# Altium project DT10965_MOTOR_CONTROLLER.PrjPcb (part 3 of 4)

## Sheet Resolver.SchDoc: =DT_SCH_Title
size A4; Organization: Droid Technologies; DocumentNumber: DT10965; Revision: 1.0; SheetNumber: 11; SheetTotal: 15
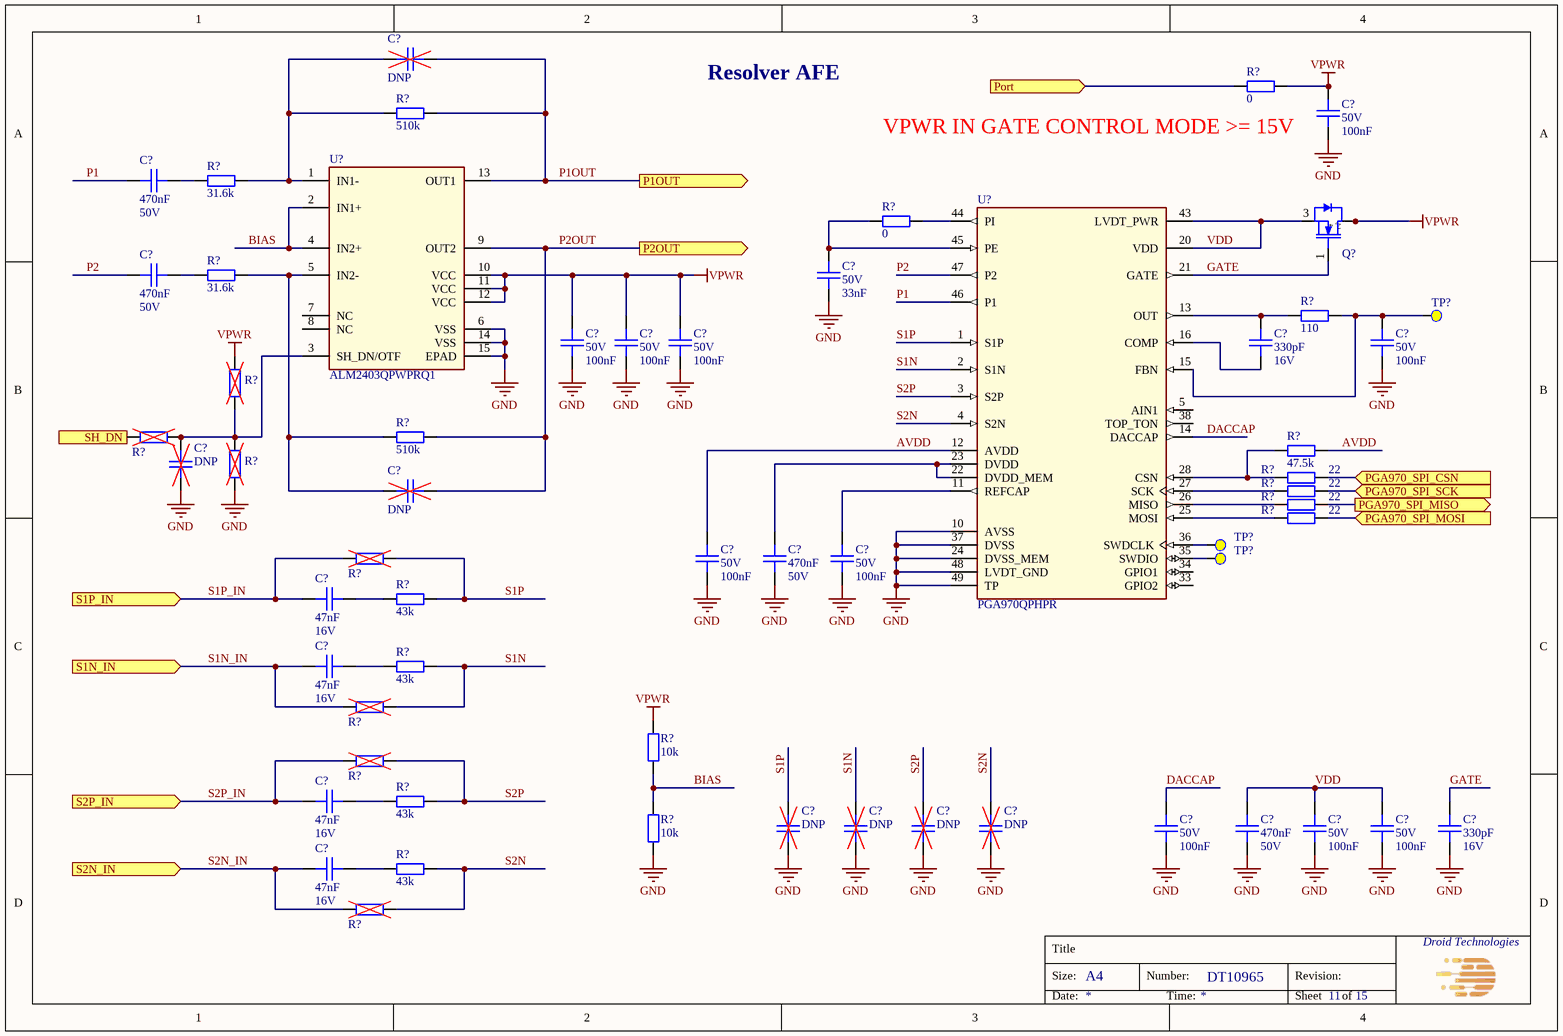
[diagram p8: Resolver.SchDoc]

### Parts
(Parts that share a designator on the sheet are numbered #1, #2 ... from top to bottom, then left to right.)
C?#111  Capacitance: DNP  [CAPC100x50x50L25]  (hidden comment: DNP chip cap 0402)
C?#112  Voltage Rating: 50V  Capacitance: 100nF  [CAPC100x50x50L25]  (hidden comment: GCM155L8EH104KE07D)
C?#113  Capacitance: 470nF  Voltage Rating: 50V  [CAPC200X125X145L50]  (hidden comment: CGA4J1X8L1H474K125AC)
C?#114  Capacitance: 470nF  Voltage Rating: 50V  [CAPC200X125X145L50]  (hidden comment: CGA4J1X8L1H474K125AC)
C?#115  Voltage Rating: 50V  Capacitance: 33nF  [CAPC100x50x50L25]  (hidden comment: GCM155L8EH333KE07D)
C?#116  Voltage Rating: 50V  Capacitance: 100nF  [CAPC100x50x50L25]  (hidden comment: GCM155L8EH104KE07D)
C?#117  Voltage Rating: 50V  Capacitance: 100nF  [CAPC100x50x50L25]  (hidden comment: GCM155L8EH104KE07D)
C?#118  Voltage Rating: 50V  Capacitance: 100nF  [CAPC100x50x50L25]  (hidden comment: GCM155L8EH104KE07D)
C?#119  Capacitance: 330pF  Voltage Rating: 16V  [CAPC160X80X90L35]  (hidden comment: C0603C331J4HACTU)
C?#120  Voltage Rating: 50V  Capacitance: 100nF  [CAPC100x50x50L25]  (hidden comment: GCM155L8EH104KE07D)
C?#121  Capacitance: DNP  [CAPC100x50x50L25]  (hidden comment: DNP chip cap 0402)
C?#122  Capacitance: DNP  [CAPC100x50x50L25]  (hidden comment: DNP chip cap 0402)
C?#123  Capacitance: 470nF  Voltage Rating: 50V  [CAPC200X125X145L50]  (hidden comment: CGA4J1X8L1H474K125AC)
C?#124  Voltage Rating: 50V  Capacitance: 100nF  [CAPC100x50x50L25]  (hidden comment: GCM155L8EH104KE07D)
C?#125  Voltage Rating: 50V  Capacitance: 100nF  [CAPC100x50x50L25]  (hidden comment: GCM155L8EH104KE07D)
C?#126  Capacitance: 47nF  Voltage Rating: 16V  [CAPC100x50x50L25]  (hidden comment: CGA2B3X8R1C473K050BB)
C?#127  Capacitance: 47nF  Voltage Rating: 16V  [CAPC100x50x50L25]  (hidden comment: CGA2B3X8R1C473K050BB)
C?#128  Capacitance: 47nF  Voltage Rating: 16V  [CAPC100x50x50L25]  (hidden comment: CGA2B3X8R1C473K050BB)
C?#129  Capacitance: 470nF  Voltage Rating: 50V  [CAPC200X125X145L50]  (hidden comment: CGA4J1X8L1H474K125AC)
C?#130  Capacitance: DNP  [CAPC100x50x50L25]  (hidden comment: DNP chip cap 0402)
C?#131  Capacitance: DNP  [CAPC100x50x50L25]  (hidden comment: DNP chip cap 0402)
C?#132  Capacitance: DNP  [CAPC100x50x50L25]  (hidden comment: DNP chip cap 0402)
C?#133  Capacitance: DNP  [CAPC100x50x50L25]  (hidden comment: DNP chip cap 0402)
C?#134  Voltage Rating: 50V  Capacitance: 100nF  [CAPC100x50x50L25]  (hidden comment: GCM155L8EH104KE07D)
C?#135  Voltage Rating: 50V  Capacitance: 100nF  [CAPC100x50x50L25]  (hidden comment: GCM155L8EH104KE07D)
C?#136  Voltage Rating: 50V  Capacitance: 100nF  [CAPC100x50x50L25]  (hidden comment: GCM155L8EH104KE07D)
C?#137  Capacitance: 330pF  Voltage Rating: 16V  [CAPC160X80X90L35]  (hidden comment: C0603C331J4HACTU)
C?#138  Capacitance: 47nF  Voltage Rating: 16V  [CAPC100x50x50L25]  (hidden comment: CGA2B3X8R1C473K050BB)
Q?#7  BSP129H6327XTSA1  [SOT-223]  (value not drawn)
R?#146  Resistance: 0  [RESC160X80X55L30]  (hidden comment: RC0603FR-070RL)
R?#147  Resistance: 510k  [RESC100X50X40L25]  (hidden comment: RC0402FR-07510KL)
R?#148  Resistance: 31.6k  [RESC100X50X40L25]  (hidden comment: RC0402FR-0731K6L)
R?#149  Resistance: 0  [RESC160X80X55L30]  (hidden comment: RC0603FR-070RL)
R?#150  Resistance: 31.6k  [RESC100X50X40L25]  (hidden comment: RC0402FR-0731K6L)
R?#151  Resistance: 110  [RESC100X50X40L25]  (hidden comment: RC0402FR-07110RL)
R?#152  DNP chip res 0603  [RESC160X80X55L30]  (value not drawn)
R?#153  DNP chip res 0603  [RESC160X80X55L30]  (value not drawn)
R?#154  Resistance: 510k  [RESC100X50X40L25]  (hidden comment: RC0402FR-07510KL)
R?#155  Resistance: 47.5k  [RESC100X50X40L25]  (hidden comment: RC0402FR-0747K5L)
R?#156  Resistance: 22  [RESC100X50X40L25]  (hidden comment: RC0402FR-0722RL)
R?#157  DNP chip res 0603  [RESC160X80X55L30]  (value not drawn)
R?#158  Resistance: 22  [RESC100X50X40L25]  (hidden comment: RC0402FR-0722RL)
R?#159  Resistance: 22  [RESC100X50X40L25]  (hidden comment: RC0402FR-0722RL)
R?#160  Resistance: 22  [RESC100X50X40L25]  (hidden comment: RC0402FR-0722RL)
R?#161  DNP chip res 0603  [RESC160X80X55L30]  (value not drawn)
R?#162  Resistance: 43k  [RESC100X50X40L25]  (hidden comment: RC0402FR-0743KL)
R?#163  Resistance: 43k  [RESC100X50X40L25]  (hidden comment: RC0402FR-0743KL)
R?#164  DNP chip res 0603  [RESC160X80X55L30]  (value not drawn)
R?#165  DNP chip res 0603  [RESC160X80X55L30]  (value not drawn)
R?#166  Resistance: 10k  [RESC100X50X40L25]  (hidden comment: RC0402FR-0710KL)
R?#167  Resistance: 43k  [RESC100X50X40L25]  (hidden comment: RC0402FR-0743KL)
R?#168  Resistance: 10k  [RESC100X50X40L25]  (hidden comment: RC0402FR-0710KL)
R?#169  Resistance: 43k  [RESC100X50X40L25]  (hidden comment: RC0402FR-0743KL)
R?#170  DNP chip res 0603  [RESC160X80X55L30]  (value not drawn)
TP?#1  TPAD  [PAD_1.0R]  (value not drawn)  (no BOM)
TP?#2  TPAD  [PAD_1.0R]  (value not drawn)  (no BOM)
TP?#3  TPAD  [PAD_1.0R]  (value not drawn)  (no BOM)
U?#32  ALM2403QPWPRQ1  [14-HTSSOP]
U?#33  PGA970QPHPR  [48-HTQFP (7x7)]

### Ports
P1OUT (out), P2OUT (out), PGA970_SPI_CSN (in), PGA970_SPI_MISO (out), PGA970_SPI_MOSI (in), PGA970_SPI_SCK (in), Port (in), S1N_IN (in), S1P_IN (in), S2N_IN (in), S2P_IN (in), SH_DN (out)

### Nets
GND: C?#112.1 C?#115.1 C?#116.1 C?#117.1 C?#118.1 C?#120.1 C?#121.2 C?#123.2 C?#124.1 C?#125.1 C?#129.2 C?#130.1 C?#131.1 C?#132.1 C?#133.1 C?#134.1 C?#135.1 C?#136.1 C?#137.1 R?#157.1 R?#168.1 U?#32.6(VSS) U?#32.14(VSS) U?#32.15(EPAD) U?#33.10(AVSS) U?#33.24(DVSS_MEM) U?#33.37(DVSS) U?#33.48(LVDT_GND) U?#33.49(TP)
VPWR: C?#112.2 C?#116.2 C?#117.2 C?#118.2 Q?#7.2(DRAIN) Q?#7.4(DRAIN) R?#146.2 R?#152.2 R?#166.2 U?#32.10(VCC) U?#32.11(VCC) U?#32.12(VCC)
AVDD: C?#124.2 R?#155.1 U?#33.12(AVDD)
BIAS: R?#166.1 R?#168.2 U?#32.2(IN1+) U?#32.4(IN2+)
DACCAP: C?#134.2 U?#33.14(DACCAP)
GATE: C?#137.2 Q?#7.1(GATE) U?#33.21(GATE)
P1: C?#113.2 U?#33.46(P1)
P1OUT: C?#111.1 R?#147.2 U?#32.13(OUT1) ; port P1OUT
P2: C?#114.2 U?#33.47(P2)
P2OUT: C?#122.1 R?#154.2 U?#32.9(OUT2) ; port P2OUT
S1N: C?#131.2 R?#163.2 R?#164.1 U?#33.2(S1N)
S1N_IN: C?#127.2 R?#164.2 ; port S1N_IN
S1P: C?#130.2 R?#161.1 R?#162.2 U?#33.1(S1P)
S1P_IN: C?#126.2 R?#161.2 ; port S1P_IN
S2N: C?#133.2 R?#169.2 R?#170.1 U?#33.4(S2N)
S2N_IN: C?#138.2 R?#170.2 ; port S2N_IN
S2P: C?#132.2 R?#165.1 R?#167.2 U?#33.3(S2P)
S2P_IN: C?#128.2 R?#165.2 ; port S2P_IN
VDD: C?#129.1 C?#135.2 C?#136.2 Q?#7.3(SOURCE) U?#33.20(VDD) U?#33.43(LVDT_PWR)
NetC?#111_2: C?#111.2 R?#147.1 R?#148.2 U?#32.1(IN1-)
NetC?#113_1: C?#113.1 R?#148.1
NetC?#114_1: C?#114.1 R?#150.1
NetC?#115_2: C?#115.2 R?#149.1 U?#33.45(PE)
NetC?#119_1: C?#119.1 U?#33.16(COMP)
NetC?#119_2: C?#119.2 R?#151.1 U?#33.13(OUT)
NetC?#120_2: C?#120.2 R?#151.2 TP?#1.1(TPoint) U?#33.15(FBN)
NetC?#121_1: C?#121.1 R?#152.1 R?#153.1 R?#157.2 U?#32.3(SH_DN/OTF)
NetC?#122_2: C?#122.2 R?#150.2 R?#154.1 U?#32.5(IN2-)
NetC?#123_1: C?#123.1 U?#33.22(DVDD_MEM) U?#33.23(DVDD)
NetC?#125_2: C?#125.2 U?#33.11(REFCAP)
NetC?#126_1: C?#126.1 R?#162.1
NetC?#127_1: C?#127.1 R?#163.1
NetC?#128_1: C?#128.1 R?#167.1
NetC?#138_1: C?#138.1 R?#169.1
NetR?#146_1: R?#146.1 ; port Port
NetR?#149_2: R?#149.2 U?#33.44(PI)
NetR?#153_2: R?#153.2 ; port SH_DN
NetR?#155_2: R?#155.2 R?#156.1 U?#33.28(CSN)
NetR?#156_2: R?#156.2 ; port PGA970_SPI_CSN
NetR?#158_1: R?#158.1 U?#33.27(SCK)
NetR?#158_2: R?#158.2 ; port PGA970_SPI_SCK
NetR?#159_1: R?#159.1 U?#33.26(MISO)
NetR?#159_2: R?#159.2 ; port PGA970_SPI_MISO
NetR?#160_1: R?#160.1 U?#33.25(MOSI)
NetR?#160_2: R?#160.2 ; port PGA970_SPI_MOSI
NetTP?#2_1: TP?#2.1(TPoint) U?#33.36(SWDCLK)
NetTP?#3_1: TP?#3.1(TPoint) U?#33.35(SWDIO)

Not connected (* = marked no-connect by the designer): U?#32 7(NC) 8(NC); U?#33 5(AIN1) 33(GPIO2) 34(GPIO1) 38(TOP_TON)

### Notes on the sheet
- Resolver AFE
- (near R?#146) VPWR IN GATE CONTROL MODE >= 15V
- Title
- Size:
- A4
- Number:
- Revision:
- Date:
- Time:
- Sheet
- of
- (in symbol BSP129H6327XTSA1) 2, 4

### Library data of the parts
C?#111 C?#121 C?#122 C?#130-C?#133 = CMP-00427-4: DNP cap 0402; Mounting Type: SM; Package: 0402 (1005 Metric); MPN: DNP
C?#112 C?#116-C?#118 C?#120 C?#124 C?#125 C?#134-C?#136 = CMP-001-1980-1: as C?#91-C?#94 on sheet Phase Current_Voltage Sense; Height max: 550µm; ComponentLink3Description: Digikey; Mounting Type: SM; ComponentLink3URL: https://www.digikey.com/en/products/detail/murata-electronics/GCM155L8EH104KE07D/11618823; Package: 0402 (1005 Metric); Lead Spacing: 0mm; MPN: GCM155L8EH104KE07D; Size: 1.00mm x 0.50mm; Ratings: AEC-Q200; ComponentLink1URL: https://search.murata.co.jp/Ceramy/image/img/A01X/G101/ENG/GCM155L8EH104KE07-01.pdf; ComponentLink1Description: Datasheet; Dielectric: X8L; ComponentLink2Description: Mouser; ComponentLink2URL: https://eu.mouser.com/ProductDetail/Murata-Electronics/GCM155L8EH104KE07D?qs=1mbolxNpo8fQSHf0HYnZWw%3D%3D
C?#113 C?#114 C?#123 C?#129 = CMP-001-2015-1: CAP CER 0.47UF 50V X8L 0805; Manufacturer: TDK Corporation; Op Temp min: -55°C; Tolerance: 10%; Op Temp max: 150°C; ComponentLink1Description: Datasheet; Size: 2.00mm x 1.25mm; Dielectric: X8L; ComponentLink3URL: https://www.digikey.com/en/products/detail/tdk-corporation/CGA4J1X8L1H474K125AC/12807037?s=N4IgjCBcoKxaBjKAzAhgGwM4FMA0IB7KAbRAGYYAWAdgA5KQBdfABwBcoQBlNgJwEsAdgHMQAX3xgG0EEkhoseQiRAAmMrWoamrDpG58hoieABs8WSgw58RSKTIBOMqsc6Q7TjwEjx%2BU24ycgo2yvYglAAMjpRg5sweegY%2BxviqMKoWwdZKdqSqlK5kEGmFztQgpa6xlWpllLTunvreRn7gjrSBiFaKtiqRTCaqkZTdlvI5-eGRAHQ0AAQArQBitTSRC4JrCc0gAKqC-GwA8sgAstiomACuvNjtALSZQVB8N7kqcPhujCaP4zk70%2B4QgfzEYiAA; Ratings: AEC-Q200; ComponentLink3Description: Digikey; ComponentLink2Description: Mouser; Mounting Type: SM; Lead Spacing: 0mm; ComponentLink1URL: https://product.tdk.com/system/files/dam/doc/product/capacitor/ceramic/mlcc/catalog/mlcc_automotive_hightemp_en.pdf; MPN: CGA4J1X8L1H474K125AC; Height max: 1.45mm; ComponentLink2URL: https://eu.mouser.com/ProductDetail/TDK/CGA4J1X8L1H474K125AC?qs=W%2FMpXkg%252BdQ5d8zdfD6mokw%3D%3D; Package: 0805 (2012 Metric)
C?#115 = CMP-001-2007-1: CAP CER 0.033UF 50V X8L 0402; Manufacturer: Murata Electronics; Op Temp max: 150°C; Tolerance: 10%; Op Temp min: -55°C; ComponentLink1URL: https://search.murata.co.jp/Ceramy/image/img/A01X/G101/ENG/GCM155L8EH333KE07-01A.pdf; Mounting Type: SM; Dielectric: X8L; ComponentLink3URL: https://www.digikey.com/en/products/detail/murata-electronics/GCM155L8EH333KE07D/17845188; Size: 1.00mm x 0.50mm; ComponentLink1Description: Datasheet; ComponentLink3Description: Digikey; Package: 0402 (1005 Metric); MPN: GCM155L8EH333KE07D; ComponentLink2Description: Mouser; Height max: 550µm; Lead Spacing: 0mm; ComponentLink2URL: https://eu.mouser.com/ProductDetail/Murata-Electronics/GCM155L8EH333KE07D?qs=rrS6PyfT74cZK6FfR7MiFw%3D%3D; Ratings: AEC-Q200
C?#119 C?#137 = CMP-001-2014-1: CAP CER 330PF 16V X8R 0603; Manufacturer: KEMET; Op Temp max: 150°C; Tolerance: 5%; Op Temp min: -55°C; ComponentLink2URL: https://eu.mouser.com/ProductDetail/KEMET/C0603C331J4HACTU?qs=W0yvOO0ixfGIN%252BOCnjHNiQ%3D%3D; MPN: C0603C331J4HACTU; Ratings: -; Height max: 870µm; ComponentLink1Description: Datasheet; ComponentLink3URL: https://www.digikey.com/en/products/detail/kemet/C0603C331J4HACTU/7946553?s=N4IgjCBcpgLFoDGUBmBDANgZwKYBoQB7KAbXAAYAOAdlgCYQBdAgBwBcoQBlNgJwEsAdgHMQAXwJ0ArA2ghkkdNnxFSIOvQCcAZgjMQ7TjwEjxBMJsqaE81JlwFikMuSYT15WNbkKlD1c4g2trkAAQsAGJMrByQIACqgvxsAPIoALI4aFgArrw4ZiAAtLJIUHw5Kk5kUiAE1ozuRd5lkBVVanpi3UA; Size: 1.60mm x 0.80mm; ComponentLink2Description: Mouser; Package: 0603 (1608 Metric); ComponentLink3Description: Digikey; Lead Spacing: 0mm; Mounting Type: SM; Dielectric: X8R; ComponentLink1URL: https://search.kemet.com/download/datasheet/C0603C331J4HAC7867
C?#126-C?#128 C?#138 = CMP-001-2016-1: CAP CER 0.047UF 16V X8R 0402; Manufacturer: TDK Corporation; Op Temp min: -55°C; Op Temp max: 150°C; Tolerance: 10%; Lead Spacing: 0mm; ComponentLink2Description: Mouser; ComponentLink2URL: https://eu.mouser.com/ProductDetail/TDK/CGA2B3X8R1C473K050BB?qs=7GgVL%252Bg%252BDME3TQb%252Bbj%2FjaA%3D%3D; ComponentLink1Description: Datasheet; ComponentLink3URL: https://www.digikey.com/en/products/detail/tdk-corporation/CGA2B3X8R1C473K050BB/3949531; Dielectric: X8R; ComponentLink3Description: Digikey; Height max: 550µm; ComponentLink1URL: https://product.tdk.com/system/files/dam/doc/product/capacitor/ceramic/mlcc/catalog/mlcc_automotive_hightemp_en.pdf; MPN: CGA2B3X8R1C473K050BB; Ratings: AEC-Q200; Size: 1.00mm x 0.50mm; Package: 0402 (1005 Metric); Mounting Type: SM
Q?#7 = BSP129H6327XTSA1: MOSFET N-CH 240V 350MA SOT223-4; Manufacturer: Infineon Technologies; MPN: BSP129H6327XTSA1
R?#146 R?#149 = CMP-001-0927-2: as R?#120-R?#122 on sheet Phase Current_Voltage Sense; Height max: 550µm; ComponentLink2URL: https://eu.mouser.com/ProductDetail/YAGEO/RC0603FR-070RL?qs=0yPvnVz5%2FmpDQv43TwvCfw%3D%3D; Temperature Coefficient: -; ComponentLink3Description: Digikey; ComponentLink2Description: Mouser; MPN: RC0603FR-070RL; ComponentLink1URL: https://www.yageo.com/upload/media/product/productsearch/datasheet/rchip/PYu-RC_Group_51_RoHS_L_12.pdf; Ratings: -; Size: 1.60mm x 0.80mm; Composition: Thick Film; Mounting Type: SM; ComponentLink3URL: https://www.digikey.com/en/products/detail/yageo/RC0603FR-070RL/1304008; Package: 0603 (1608 Metric); ComponentLink1Description: Datasheet
R?#147 R?#154 = CMP-001-0533-6: RES 510K OHM 1% 1/16W 0402; Manufacturer: YAGEO; Op Temp max: 155°C; Temperature Coefficient: ±100ppm; Op Temp min: -55°C; Power: 63mW; Package: 0402 (1005 Metric); Composition: Thick Film; Size: 1.00mm x 0.50mm; ComponentLink2Description: Mouser; MPN: RC0402FR-07510KL; Height max: 400µm; ComponentLink1URL: https://www.yageo.com/upload/media/product/productsearch/datasheet/rchip/PYu-RC_Group_51_RoHS_L_12.pdf; ComponentLink2URL: https://eu.mouser.com/ProductDetail/YAGEO/RC0402FR-07510KL?qs=V1yeUXFNrkkq0IeA5n8CcA%3D%3D; Tolerance: 1%; Mounting Type: SM; ComponentLink3Description: Digikey; ComponentLink3URL: https://www.digikey.com/en/products/detail/yageo/RC0402FR-07510KL/726631; Ratings: -; ComponentLink1Description: Datasheet
R?#148 R?#150 = CMP-00475-6: RES 31.6K OHM 1% 1/16W 0402; Manufacturer: YAGEO; Power: 63mW; Temperature Coefficient: ±100ppm; Op Temp max: 155°C; Op Temp min: -55°C; ComponentLink2Description: Mouser; Size: 1.00mm x 0.50mm; ComponentLink3URL: https://www.digikey.com/en/products/detail/yageo/RC0402FR-0731K6L/5280975; Composition: Thick Film; Mounting Type: SM; ComponentLink1URL: https://www.yageo.com/upload/media/product/productsearch/datasheet/rchip/PYu-RC_Group_51_RoHS_L_12.pdf; Tolerance: 1%; ComponentLink3Description: Digikey; MPN: RC0402FR-0731K6L; ComponentLink1Description: Datasheet; Ratings: -; ComponentLink2URL: https://eu.mouser.com/ProductDetail/YAGEO/RC0402FR-0731K6L?qs=tQYgeJ5sXdm2wsAqEjplmg%3D%3D; Package: 0402 (1005 Metric); Height max: 400µm
R?#151 = CMP-001-0497-6: RES 110 OHM 1% 1/16W 0402; Manufacturer: YAGEO; Power: 63mW; Op Temp min: -55°C; Op Temp max: 155°C; Temperature Coefficient: ±100ppm; Size: 1.00mm x 0.50mm; ComponentLink1Description: Datasheet; Package: 0402 (1005 Metric); ComponentLink2URL: https://eu.mouser.com/ProductDetail/YAGEO/RC0402FR-07110RL?qs=QWYorlrD8IXj7iGvwWbRbA%3D%3D; MPN: RC0402FR-07110RL; ComponentLink3Description: Digikey; Height max: 400µm; Ratings: -; ComponentLink3URL: https://www.digikey.com/en/products/detail/yageo/RC0402FR-07110RL/2827583; Composition: Thick Film; ComponentLink2Description: Mouser; Tolerance: 1%; Mounting Type: SM; ComponentLink1URL: https://www.yageo.com/upload/media/product/productsearch/datasheet/rchip/PYu-RC_Group_51_RoHS_L_12.pdf
R?#152 R?#153 R?#157 R?#161 R?#164 R?#165 R?#170 = CMP-001-0920-3: DNP res 0603; Mounting Type: SM; MPN: DNP; Package: 0603 (1608 Metric)
R?#155 = CMP-001-0277-7: RES 47.5K OHM 1% 1/16W 0402; Manufacturer: YAGEO; Op Temp min: -55°C; Power: 63mW; Temperature Coefficient: ±100ppm; Op Temp max: 155°C; ComponentLink1URL: https://www.yageo.com/upload/media/product/productsearch/datasheet/rchip/PYu-RC_Group_51_RoHS_L_12.pdf; ComponentLink1Description: Datasheet; MPN: RC0402FR-0747K5L; ComponentLink3Description: Digikey; ComponentLink2URL: https://eu.mouser.com/ProductDetail/YAGEO/RC0402FR-0747K5L?qs=V1yeUXFNrklfu86Rfgihxg%3D%3D; Mounting Type: SM; Tolerance: 1%; Package: 0402 (1005 Metric); Height max: 400µm; ComponentLink2Description: Mouser; ComponentLink3URL: https://www.digikey.com/en/products/detail/yageo/RC0402FR-0747K5L/726617; Size: 1.00mm x 0.50mm; Composition: Thick Film; Ratings: -
R?#156 R?#158-R?#160 = CMP-001-0482-4: RES 22 OHM 1% 1/16W 0402; Manufacturer: YAGEO; Temperature Coefficient: ±100ppm; Op Temp max: 155°C; Op Temp min: -55°C; Power: 63mW; Ratings: -; ComponentLink3URL: https://www.digikey.com/en/products/detail/yageo/RC0402FR-0722RL/726562; ComponentLink2URL: https://eu.mouser.com/ProductDetail/YAGEO/RC0402FR-0722RL?qs=V1yeUXFNrkkRg6zf08ADKQ%3D%3D; MPN: RC0402FR-0722RL; ComponentLink1Description: Datasheet; ComponentLink3Description: Digikey; Tolerance: 1%; Size: 1.00mm x 0.50mm; ComponentLink1URL: https://www.yageo.com/upload/media/product/productsearch/datasheet/rchip/PYu-RC_Group_51_RoHS_L_12.pdf; Composition: Thick Film; ComponentLink2Description: Mouser; Mounting Type: SM; Package: 0402 (1005 Metric); Height max: 400µm
R?#162 R?#163 R?#167 R?#169 = CMP-001-0515-6: RES 43K OHM 1% 1/16W 0402; Manufacturer: YAGEO; Op Temp min: -55°C; Temperature Coefficient: ±100ppm; Power: 63mW; Op Temp max: 155°C; Size: 1.00mm x 0.50mm; Package: 0402 (1005 Metric); ComponentLink3URL: https://www.digikey.com/en/products/detail/yageo/RC0402FR-0743KL/726609; ComponentLink1Description: Datasheet; Composition: Thick Film; Mounting Type: SM; Height max: 400µm; ComponentLink2URL: https://eu.mouser.com/ProductDetail/YAGEO/RC0402FR-0743KL?qs=Is6ZsIPfHkZH7Q2ies02Tw%3D%3D; ComponentLink1URL: https://www.yageo.com/upload/media/product/productsearch/datasheet/rchip/PYu-RC_Group_51_RoHS_L_12.pdf; Ratings: -; ComponentLink2Description: Mouser; MPN: RC0402FR-0743KL; ComponentLink3Description: Digikey; Tolerance: 1%
R?#166 R?#168 = CMP-00010-6: RES 10K OHM 1% 1/16W 0402; Manufacturer: YAGEO; Op Temp max: 155°C; Op Temp min: -55°C; Power: 63mW; Temperature Coefficient: ±100ppm; ComponentLink3URL: https://www.digikey.com/en/products/detail/yageo/RC0402FR-0710KL/726523; ComponentLink1Description: Datasheet; Height max: 400µm; ComponentLink3Description: Digikey; ComponentLink2URL: https://www2.mouser.com/ProductDetail/YAGEO/RC0402FR-0710KL?qs=%2Fha2pyFaduhjtLcYvKXQ8NAGbRXkQ%2Fwl6RsvWHeV66MSeqLhkcF3rg%3D%3D; Ratings: -; MPN: RC0402FR-0710KL; ComponentLink1URL: https://www.yageo.com/upload/media/product/productsearch/datasheet/rchip/PYu-RC_Group_51_RoHS_L_12.pdf; ComponentLink2Description: Mouser; Mounting Type: SM; Tolerance: 1%; Composition: Thick Film; Size: 1.00mm x 0.50mm; Package: 0402 (1005 Metric)
TP?#1-TP?#3 = TPAD: Test Pad, SMD; Group: Test point
U?#32 = ALM2403QPWPRQ1: IC OPAMP GP 2 CIRCUIT 14HTSSOP; Manufacturer: Texas Instruments; MPN: ALM2403QPWPRQ1
U?#33 = PGA970QPHPR: IC SGNL CONDITIONER LVDT 48HTQFP; Manufacturer: Texas Instruments; MPN: PGA970QPHPR

## Sheet Pressure_sensor_AFE.SchDoc: =DT_SCH_Title
size A4; Organization: Droid Technologies; DocumentNumber: DT10965; Revision: 1.0; SheetNumber: 12; SheetTotal: 15
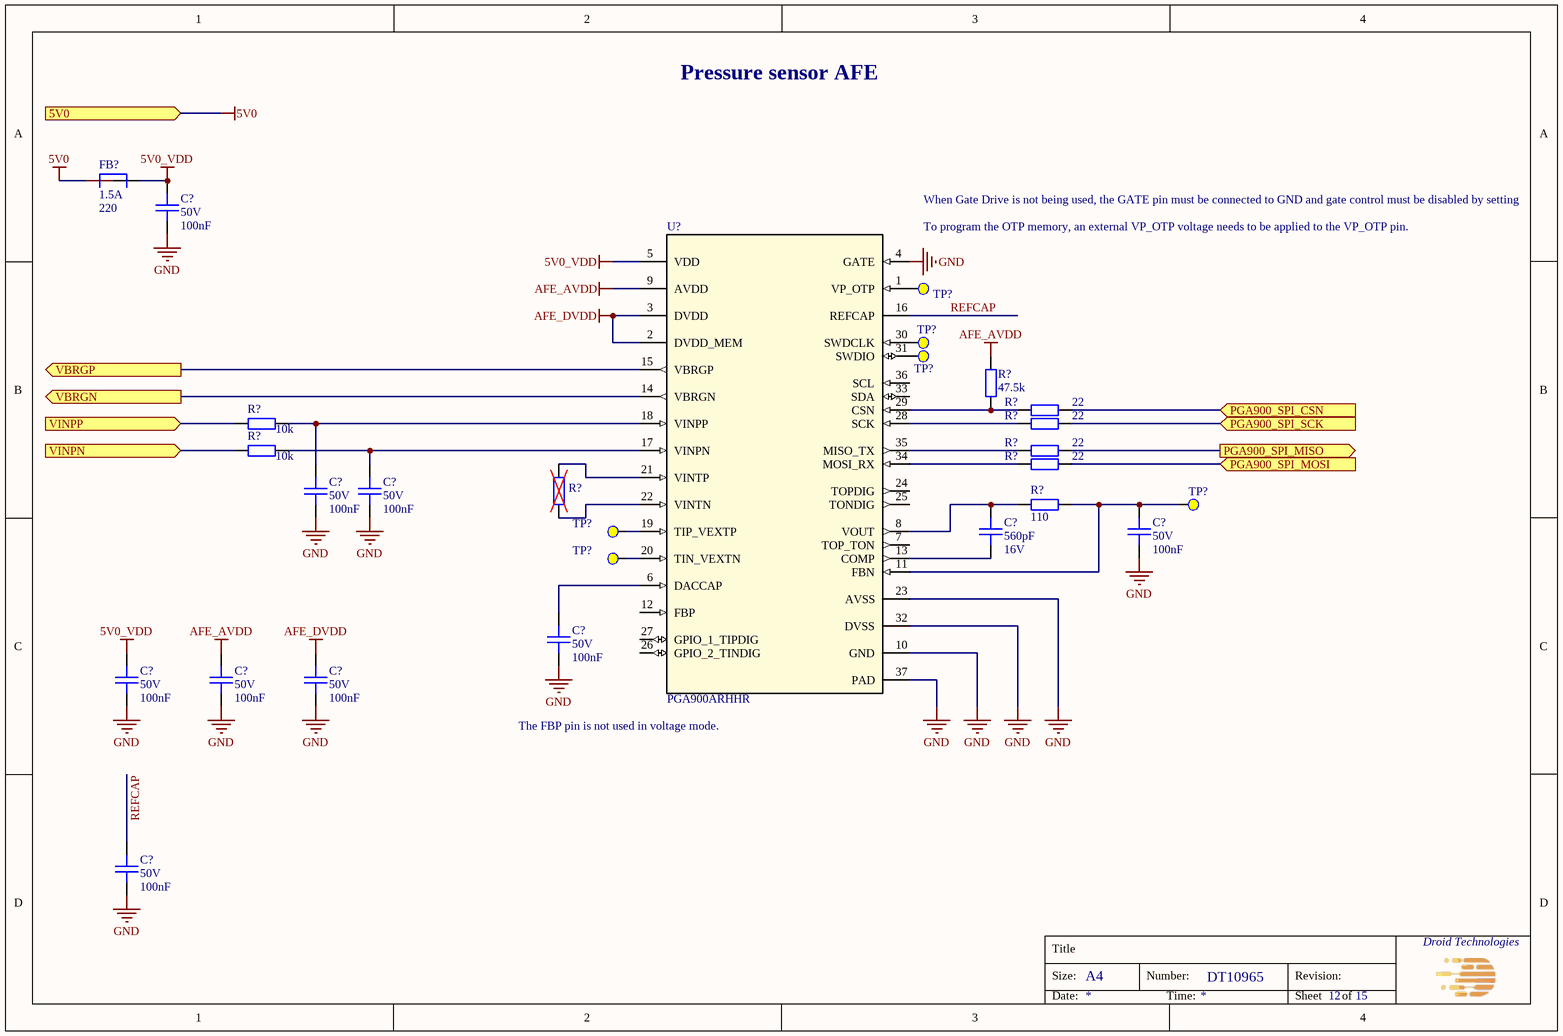
[diagram p9: Pressure_sensor_AFE.SchDoc]

### Parts
(Parts that share a designator on the sheet are numbered #1, #2 ... from top to bottom, then left to right.)
C?#139  Voltage Rating: 50V  Capacitance: 100nF  [CAPC100x50x50L25]  (hidden comment: GCM155L8EH104KE07D)
C?#140  Voltage Rating: 50V  Capacitance: 100nF  [CAPC100x50x50L25]  (hidden comment: GCM155L8EH104KE07D)
C?#141  Voltage Rating: 50V  Capacitance: 100nF  [CAPC100x50x50L25]  (hidden comment: GCM155L8EH104KE07D)
C?#142  Capacitance: 560pF  Voltage Rating: 16V  [CAPC100x50x50L25]  (hidden comment: C0402C561F4HACAUTO)
C?#143  Voltage Rating: 50V  Capacitance: 100nF  [CAPC100x50x50L25]  (hidden comment: GCM155L8EH104KE07D)
C?#144  Voltage Rating: 50V  Capacitance: 100nF  [CAPC100x50x50L25]  (hidden comment: GCM155L8EH104KE07D)
C?#145  Voltage Rating: 50V  Capacitance: 100nF  [CAPC100x50x50L25]  (hidden comment: GCM155L8EH104KE07D)
C?#146  Voltage Rating: 50V  Capacitance: 100nF  [CAPC100x50x50L25]  (hidden comment: GCM155L8EH104KE07D)
C?#147  Voltage Rating: 50V  Capacitance: 100nF  [CAPC100x50x50L25]  (hidden comment: GCM155L8EH104KE07D)
C?#148  Voltage Rating: 50V  Capacitance: 100nF  [CAPC100x50x50L25]  (hidden comment: GCM155L8EH104KE07D)
FB?#11  Imax: 1.5A  Impedance: 220  [BEADC160X80X95L40]  (hidden comment: BLM18KG221BH1D)
R?#171  Resistance: 47.5k  [RESC100X50X40L25]  (hidden comment: RC0402FR-0747K5L)
R?#172  Resistance: 22  [RESC100X50X40L25]  (hidden comment: RC0402FR-0722RL)
R?#173  Resistance: 10k  [RESC100X50X40L25]  (hidden comment: RC0402FR-0710KL)
R?#174  Resistance: 22  [RESC100X50X40L25]  (hidden comment: RC0402FR-0722RL)
R?#175  Resistance: 10k  [RESC100X50X40L25]  (hidden comment: RC0402FR-0710KL)
R?#176  Resistance: 22  [RESC100X50X40L25]  (hidden comment: RC0402FR-0722RL)
R?#177  Resistance: 22  [RESC100X50X40L25]  (hidden comment: RC0402FR-0722RL)
R?#178  Resistance: 110  [RESC100X50X40L25]  (hidden comment: RC0402FR-07110RL)
R?#179  DNP chip res 0603  [RESC160X80X55L30]  (value not drawn)
TP?#4  TPAD  [PAD_1.0R]  (value not drawn)  (no BOM)
TP?#5  TPAD  [PAD_1.0R]  (value not drawn)  (no BOM)
TP?#6  TPAD  [PAD_1.0R]  (value not drawn)  (no BOM)
TP?#7  TPAD  [PAD_1.0R]  (value not drawn)  (no BOM)
TP?#8  TPAD  [PAD_1.0R]  (value not drawn)  (no BOM)
TP?#9  TPAD  [PAD_1.0R]  (value not drawn)  (no BOM)
U?#34  PGA900ARHHR  [36VQFN]

### Ports
5V0 (in), PGA900_SPI_CSN (in), PGA900_SPI_MISO (out), PGA900_SPI_MOSI (in), PGA900_SPI_SCK (in), VBRGN (out), VBRGP (out), VINPN (in), VINPP (in)

### Nets
5V0: FB?#11.1 ; port 5V0
5V0_VDD: C?#139.2 C?#145.2 FB?#11.2 U?#34.5(VDD)
AFE_AVDD: C?#146.2 R?#171.2 U?#34.9(AVDD)
AFE_DVDD: C?#147.2 U?#34.2(DVDD_MEM) U?#34.3(DVDD)
GND: C?#139.1 C?#140.1 C?#141.1 C?#143.1 C?#144.1 C?#145.1 C?#146.1 C?#147.1 C?#148.1 U?#34.4(GATE) U?#34.10(GND) U?#34.23(AVSS) U?#34.32(DVSS) U?#34.37(PAD)
REFCAP: C?#148.2 U?#34.16(REFCAP)
NetC?#140_2: C?#140.2 R?#173.2 U?#34.18(VINPP)
NetC?#141_2: C?#141.2 R?#175.2 U?#34.17(VINPN)
NetC?#142_1: C?#142.1 U?#34.13(COMP)
NetC?#142_2: C?#142.2 R?#178.1 U?#34.8(VOUT)
NetC?#143_2: C?#143.2 R?#178.2 TP?#7.1(TPoint) U?#34.11(FBN)
NetC?#144_2: C?#144.2 U?#34.6(DACCAP)
NetR?#171_1: R?#171.1 R?#172.1 U?#34.29(CSN)
NetR?#172_2: R?#172.2 ; port PGA900_SPI_CSN
NetR?#173_1: R?#173.1 ; port VINPP
NetR?#174_1: R?#174.1 U?#34.28(SCK)
NetR?#174_2: R?#174.2 ; port PGA900_SPI_SCK
NetR?#175_1: R?#175.1 ; port VINPN
NetR?#176_1: R?#176.1 U?#34.35(MISO_TX)
NetR?#176_2: R?#176.2 ; port PGA900_SPI_MISO
NetR?#177_1: R?#177.1 U?#34.34(MOSI_RX)
NetR?#177_2: R?#177.2 ; port PGA900_SPI_MOSI
NetR?#179_1: R?#179.1 U?#34.22(VINTN)
NetR?#179_2: R?#179.2 U?#34.21(VINTP)
NetTP?#4_1: TP?#4.1(TPoint) U?#34.1(VP_OTP)
NetTP?#5_1: TP?#5.1(TPoint) U?#34.30(SWDCLK)
NetTP?#6_1: TP?#6.1(TPoint) U?#34.31(SWDIO)
NetTP?#8_1: TP?#8.1(TPoint) U?#34.19(TIP_VEXTP)
NetTP?#9_1: TP?#9.1(TPoint) U?#34.20(TIN_VEXTN)
NetU?#34_14: U?#34.14(VBRGN) ; port VBRGN
NetU?#34_15: U?#34.15(VBRGP) ; port VBRGP

Not connected (* = marked no-connect by the designer): U?#34 7(TOP_TON) 12(FBP) 24(TOPDIG) 25(TONDIG) 26(GPIO_2_TINDIG) 27(GPIO_1_TIPDIG) 33(SDA) 36(SCL)

### Notes on the sheet
- Pressure sensor AFE
- To program the OTP memory, an external VP_OTP voltage needs to be applied to the VP_OTP pin.
- When Gate Drive is not being used, the GATE pin must be connected to GND and gate control must be disabled by setting
- (near U?#34) The FBP pin is not used in voltage mode.
- Title
- Size:
- A4
- Number:
- Revision:
- Date:
- Time:
- Sheet
- of

### Library data of the parts
C?#139-C?#141 C?#143-C?#148 = CMP-001-1980-1: as C?#91-C?#94 on sheet Phase Current_Voltage Sense; Height max: 550µm; ComponentLink3Description: Digikey; Mounting Type: SM; ComponentLink3URL: https://www.digikey.com/en/products/detail/murata-electronics/GCM155L8EH104KE07D/11618823; Package: 0402 (1005 Metric); Lead Spacing: 0mm; MPN: GCM155L8EH104KE07D; Size: 1.00mm x 0.50mm; Ratings: AEC-Q200; ComponentLink1URL: https://search.murata.co.jp/Ceramy/image/img/A01X/G101/ENG/GCM155L8EH104KE07-01.pdf; ComponentLink1Description: Datasheet; Dielectric: X8L; ComponentLink2Description: Mouser; ComponentLink2URL: https://eu.mouser.com/ProductDetail/Murata-Electronics/GCM155L8EH104KE07D?qs=1mbolxNpo8fQSHf0HYnZWw%3D%3D
C?#142 = CMP-001-2011-1: CAP CER 0402 560PF 16V ULTRA STA; Manufacturer: KEMET; Dielectric: X8R; Tolerance: 1%; Op Temp max: 150°C; Op Temp min: -55°C; Package: 0402 (1005 Metric); MPN: C0402C561F4HACAUTO; ComponentLink3Description: Digikey; Mounting Type: SM; Height max: 550µm; Lead Spacing: 0mm; ComponentLink1Description: Datasheet; ComponentLink3URL: https://www.digikey.com/en/products/detail/kemet/C0402C561F4HACAUTO/7955183?s=N4IgjCBcpgbFoDGUBmBDANgZwKYBoQB7KAbRAGYBOMAVgA4QBdAgBwBcoQBlNgJwEsAdgHMQAXwJgA7AhDJI6bPiKkQAFgBMGzfGYh2nHgJHiCGmhtnzFuAsUhltGyuQh6DkbnyGiJ4SnSUVqiYtioOIAAMTH4akWpB0HIhSnaqNLCRAAQsAGJMrByeAKqC-GwA8igAsjhoWACuvDimIAC0lknyfA3K9mQ0MbHpmSwoMUA; ComponentLink2URL: https://eu.mouser.com/ProductDetail/KEMET/C0402C561F4HACAUTO?qs=j%252B1pi9TdxUZljUlO6hXHJQ%3D%3D; ComponentLink2Description: Mouser; ComponentLink1URL: https://content.kemet.com/datasheets/KEM_C1007_X8R_ULTRA_150C_SMD.pdf; Ratings: AEC-Q200; Size: 1.00mm x 0.50mm
FB?#11 = CMP-001-1981-1: FERRITE BEAD 220 OHM 0603 1LN; Manufacturer: Murata Electronics; DCR: 50m; Op Temp min: -55°C; Frequency: 100MHz; Op Temp max: 150°C; Number of Lines: 1; Mounting Type: SM; Size: 1.60mm x 0.80mm; ComponentLink2URL: https://eu.mouser.com/ProductDetail/Murata-Electronics/BLM18KG221BH1D?qs=sJ5gq5MLFXpgEHYBdWUtkQ%3D%3D; ComponentLink1Description: Datasheet; ComponentLink1URL: https://www.murata.com/en-us/products/productdata/8798137286686/QNFA9129.pdf; Lead Spacing: 0mm; Ratings: AEC-Q200; ComponentLink3Description: Digikey; ComponentLink3URL: https://www.digikey.com/en/products/detail/murata-electronics/BLM18KG221BH1D/6156000; Height max: 950µm; Package: 0603 (1608 Metric); ComponentLink2Description: Mouser; MPN: BLM18KG221BH1D
R?#171 = CMP-001-0277-7: as R?#155 on sheet Resolver; ComponentLink1URL: https://www.yageo.com/upload/media/product/productsearch/datasheet/rchip/PYu-RC_Group_51_RoHS_L_12.pdf; ComponentLink1Description: Datasheet; MPN: RC0402FR-0747K5L; ComponentLink3Description: Digikey; ComponentLink2URL: https://eu.mouser.com/ProductDetail/YAGEO/RC0402FR-0747K5L?qs=V1yeUXFNrklfu86Rfgihxg%3D%3D; Mounting Type: SM; Tolerance: 1%; Package: 0402 (1005 Metric); Height max: 400µm; ComponentLink2Description: Mouser; ComponentLink3URL: https://www.digikey.com/en/products/detail/yageo/RC0402FR-0747K5L/726617; Size: 1.00mm x 0.50mm; Composition: Thick Film; Ratings: -
R?#172 R?#174 R?#176 R?#177 = CMP-001-0482-4: as R?#156 on sheet Resolver; Ratings: -; ComponentLink3URL: https://www.digikey.com/en/products/detail/yageo/RC0402FR-0722RL/726562; ComponentLink2URL: https://eu.mouser.com/ProductDetail/YAGEO/RC0402FR-0722RL?qs=V1yeUXFNrkkRg6zf08ADKQ%3D%3D; MPN: RC0402FR-0722RL; ComponentLink1Description: Datasheet; ComponentLink3Description: Digikey; Tolerance: 1%; Size: 1.00mm x 0.50mm; ComponentLink1URL: https://www.yageo.com/upload/media/product/productsearch/datasheet/rchip/PYu-RC_Group_51_RoHS_L_12.pdf; Composition: Thick Film; ComponentLink2Description: Mouser; Mounting Type: SM; Package: 0402 (1005 Metric); Height max: 400µm
R?#173 R?#175 = CMP-00010-6: as R?#166 on sheet Resolver; ComponentLink3URL: https://www.digikey.com/en/products/detail/yageo/RC0402FR-0710KL/726523; ComponentLink1Description: Datasheet; Height max: 400µm; ComponentLink3Description: Digikey; ComponentLink2URL: https://www2.mouser.com/ProductDetail/YAGEO/RC0402FR-0710KL?qs=%2Fha2pyFaduhjtLcYvKXQ8NAGbRXkQ%2Fwl6RsvWHeV66MSeqLhkcF3rg%3D%3D; Ratings: -; MPN: RC0402FR-0710KL; ComponentLink1URL: https://www.yageo.com/upload/media/product/productsearch/datasheet/rchip/PYu-RC_Group_51_RoHS_L_12.pdf; ComponentLink2Description: Mouser; Mounting Type: SM; Tolerance: 1%; Composition: Thick Film; Size: 1.00mm x 0.50mm; Package: 0402 (1005 Metric)
R?#178 = CMP-001-0497-6: as R?#151 on sheet Resolver; Size: 1.00mm x 0.50mm; ComponentLink1Description: Datasheet; Package: 0402 (1005 Metric); ComponentLink2URL: https://eu.mouser.com/ProductDetail/YAGEO/RC0402FR-07110RL?qs=QWYorlrD8IXj7iGvwWbRbA%3D%3D; MPN: RC0402FR-07110RL; ComponentLink3Description: Digikey; Height max: 400µm; Ratings: -; ComponentLink3URL: https://www.digikey.com/en/products/detail/yageo/RC0402FR-07110RL/2827583; Composition: Thick Film; ComponentLink2Description: Mouser; Tolerance: 1%; Mounting Type: SM; ComponentLink1URL: https://www.yageo.com/upload/media/product/productsearch/datasheet/rchip/PYu-RC_Group_51_RoHS_L_12.pdf
R?#179 = CMP-001-0920-3: DNP res 0603; Mounting Type: SM; MPN: DNP; Package: 0603 (1608 Metric)
TP?#4-TP?#9 = TPAD: Test Pad, SMD; Group: Test point
U?#34 = PGA900ARHHR: IC PROG SENSOR SGNL COND 36VQFN; Manufacturer: Texas Instruments; MPN: PGA900ARHHR

## Sheet Calendar.SchDoc: =DT_SCH_Title
size A4; Organization: Droid Technologies; DocumentNumber: DT10965; Revision: 1.0; SheetNumber: 12; SheetTotal: 12
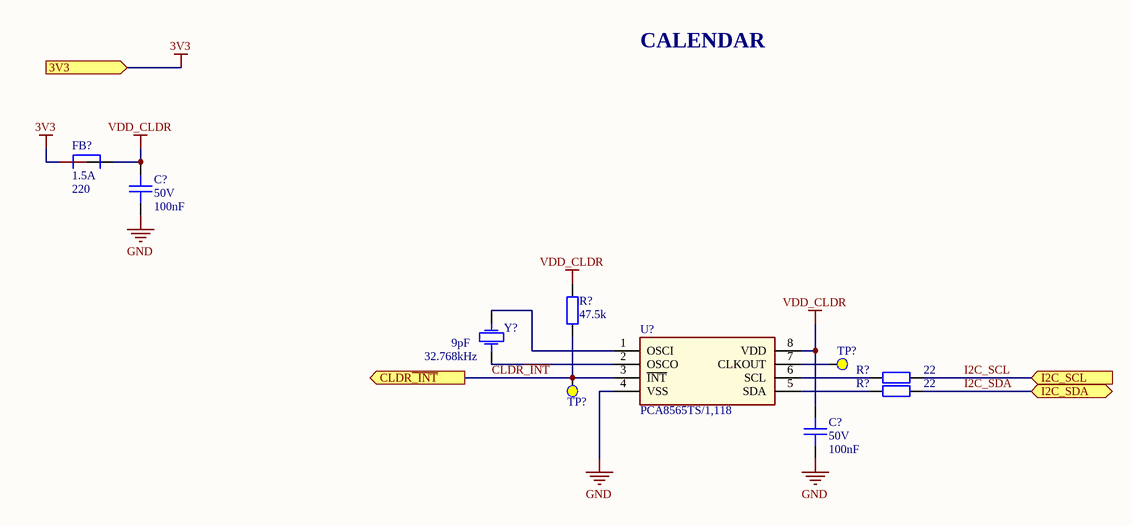
[diagram p10: Calendar.SchDoc]

### Parts
(Parts that share a designator on the sheet are numbered #1, #2 ... from top to bottom, then left to right.)
C?#149  Voltage Rating: 50V  Capacitance: 100nF  [CAPC100x50x50L25]  (hidden comment: GCM155L8EH104KE07D)
C?#150  Voltage Rating: 50V  Capacitance: 100nF  [CAPC100x50x50L25]  (hidden comment: GCM155L8EH104KE07D)
FB?#12  Imax: 1.5A  Impedance: 220  [BEADC160X80X95L40]  (hidden comment: BLM18KG221BH1D)
R?#180  Resistance: 47.5k  [RESC100X50X40L25]  (hidden comment: RC0402FR-0747K5L)
R?#181  Resistance: 22  [RESC100X50X40L25]  (hidden comment: RC0402FR-0722RL)
R?#182  Resistance: 22  [RESC100X50X40L25]  (hidden comment: RC0402FR-0722RL)
TP?#10  TPAD  [PAD_1.0R]  (value not drawn)  (no BOM)
TP?#11  TPAD  [PAD_1.0R]  (value not drawn)  (no BOM)
U?#35  PCA8565TS/1,118  [MINISOIC-8]
Y?#2  C load: 9pF  F: 32.768kHz  [XTALDFN2_320X150X85L75X150]  (hidden comment: ABS07AIG-32.768KHZ-9-1-T)

### Ports
3V3 (in), CLDR~{_INT} (out), I2C_SCL (in), I2C_SDA (bidir)

### Nets
3V3: FB?#12.1 ; port 3V3
GND: C?#149.1 C?#150.1 U?#35.4(VSS)
VDD_CLDR: C?#149.2 C?#150.2 FB?#12.2 R?#180.2 U?#35.8(VDD)
CLDR~{_INT}: R?#180.1 TP?#11.1(TPoint) U?#35.3(~{INT}) ; port CLDR~{_INT}
I2C_SCL: R?#181.2 ; port I2C_SCL
I2C_SDA: R?#182.2 ; port I2C_SDA
NetR?#181_1: R?#181.1 U?#35.6(SCL)
NetR?#182_1: R?#182.1 U?#35.5(SDA)
NetTP?#10_1: TP?#10.1(TPoint) U?#35.7(CLKOUT)
NetU?#35_1: U?#35.1(OSCI) Y?#2.1
NetU?#35_2: U?#35.2(OSCO) Y?#2.2

### Notes on the sheet
- CALENDAR
- Title
- Size:
- A4
- Number:
- Revision:
- Date:
- Time:
- Sheet
- of

### Library data of the parts
C?#149 C?#150 = CMP-001-1980-1: as C?#91-C?#94 on sheet Phase Current_Voltage Sense; Height max: 550µm; ComponentLink3Description: Digikey; Mounting Type: SM; ComponentLink3URL: https://www.digikey.com/en/products/detail/murata-electronics/GCM155L8EH104KE07D/11618823; Package: 0402 (1005 Metric); Lead Spacing: 0mm; MPN: GCM155L8EH104KE07D; Size: 1.00mm x 0.50mm; Ratings: AEC-Q200; ComponentLink1URL: https://search.murata.co.jp/Ceramy/image/img/A01X/G101/ENG/GCM155L8EH104KE07-01.pdf; ComponentLink1Description: Datasheet; Dielectric: X8L; ComponentLink2Description: Mouser; ComponentLink2URL: https://eu.mouser.com/ProductDetail/Murata-Electronics/GCM155L8EH104KE07D?qs=1mbolxNpo8fQSHf0HYnZWw%3D%3D
FB?#12 = CMP-001-1981-1: as FB?#11 on sheet Pressure_sensor_AFE; Mounting Type: SM; Size: 1.60mm x 0.80mm; ComponentLink2URL: https://eu.mouser.com/ProductDetail/Murata-Electronics/BLM18KG221BH1D?qs=sJ5gq5MLFXpgEHYBdWUtkQ%3D%3D; ComponentLink1Description: Datasheet; ComponentLink1URL: https://www.murata.com/en-us/products/productdata/8798137286686/QNFA9129.pdf; Lead Spacing: 0mm; Ratings: AEC-Q200; ComponentLink3Description: Digikey; ComponentLink3URL: https://www.digikey.com/en/products/detail/murata-electronics/BLM18KG221BH1D/6156000; Height max: 950µm; Package: 0603 (1608 Metric); ComponentLink2Description: Mouser; MPN: BLM18KG221BH1D
R?#180 = CMP-001-0277-7: as R?#155 on sheet Resolver; ComponentLink1URL: https://www.yageo.com/upload/media/product/productsearch/datasheet/rchip/PYu-RC_Group_51_RoHS_L_12.pdf; ComponentLink1Description: Datasheet; MPN: RC0402FR-0747K5L; ComponentLink3Description: Digikey; ComponentLink2URL: https://eu.mouser.com/ProductDetail/YAGEO/RC0402FR-0747K5L?qs=V1yeUXFNrklfu86Rfgihxg%3D%3D; Mounting Type: SM; Tolerance: 1%; Package: 0402 (1005 Metric); Height max: 400µm; ComponentLink2Description: Mouser; ComponentLink3URL: https://www.digikey.com/en/products/detail/yageo/RC0402FR-0747K5L/726617; Size: 1.00mm x 0.50mm; Composition: Thick Film; Ratings: -
R?#181 R?#182 = CMP-001-0482-4: as R?#156 on sheet Resolver; Ratings: -; ComponentLink3URL: https://www.digikey.com/en/products/detail/yageo/RC0402FR-0722RL/726562; ComponentLink2URL: https://eu.mouser.com/ProductDetail/YAGEO/RC0402FR-0722RL?qs=V1yeUXFNrkkRg6zf08ADKQ%3D%3D; MPN: RC0402FR-0722RL; ComponentLink1Description: Datasheet; ComponentLink3Description: Digikey; Tolerance: 1%; Size: 1.00mm x 0.50mm; ComponentLink1URL: https://www.yageo.com/upload/media/product/productsearch/datasheet/rchip/PYu-RC_Group_51_RoHS_L_12.pdf; Composition: Thick Film; ComponentLink2Description: Mouser; Mounting Type: SM; Package: 0402 (1005 Metric); Height max: 400µm
TP?#10 TP?#11 = TPAD: Test Pad, SMD; Group: Test point
U?#35 = PCA8565TS/1,118: IC RTC CLK/CALENDAR I2C 8TSSOP; Manufacturer: NXP USA Inc.; MPN: PCA8565TS/1,118
Y?#2 = CMP-001-1983-1: CRYSTAL 32.7680KHZ 9PF SMD; Manufacturer: Abracon LLC; ESR: 80k; Op Temp max: 125°C; Op Temp min: -40°C; F Tolerance: ±10ppm; Height max: 900µm; ComponentLink2Description: Mouser; Mounting Type: SM; ComponentLink3Description: Digikey; MPN: ABS07AIG-32.768KHZ-9-1-T; ComponentLink1URL: https://abracon.com/datasheets/ABS07AIG.pdf; ComponentLink2URL: https://eu.mouser.com/ProductDetail/ABRACON/ABS07AIG-32.768KHZ-9-1-T?qs=gG6m684uYP5Ouz7KwhjT2A%3D%3D; ComponentLink1Description: Datasheet; Size: 3.20mm x 1.50mm; ComponentLink3URL: https://www.digikey.com/en/products/detail/abracon-llc/ABS07AIG-32-768KHZ-9-1-T/5817553; Package: 2-SMD, No Lead; F Stability: -; Ratings: AEC-Q200

## Sheet Current_sensor.SchDoc: =DT_SCH_Title
size A4; Organization: Droid Technologies; DocumentNumber: DT10965; Revision: 1.0

### Notes on the sheet
- Title
- Size:
- A4
- Number:
- Revision:
- Date:
- Time:
- Sheet
- of

## Sheet USB_interface.SchDoc: =DT_SCH_Title
size A4; Organization: Droid Technologies; DocumentNumber: DT10965; Revision: 1.0; SheetNumber: 15; SheetTotal: 15
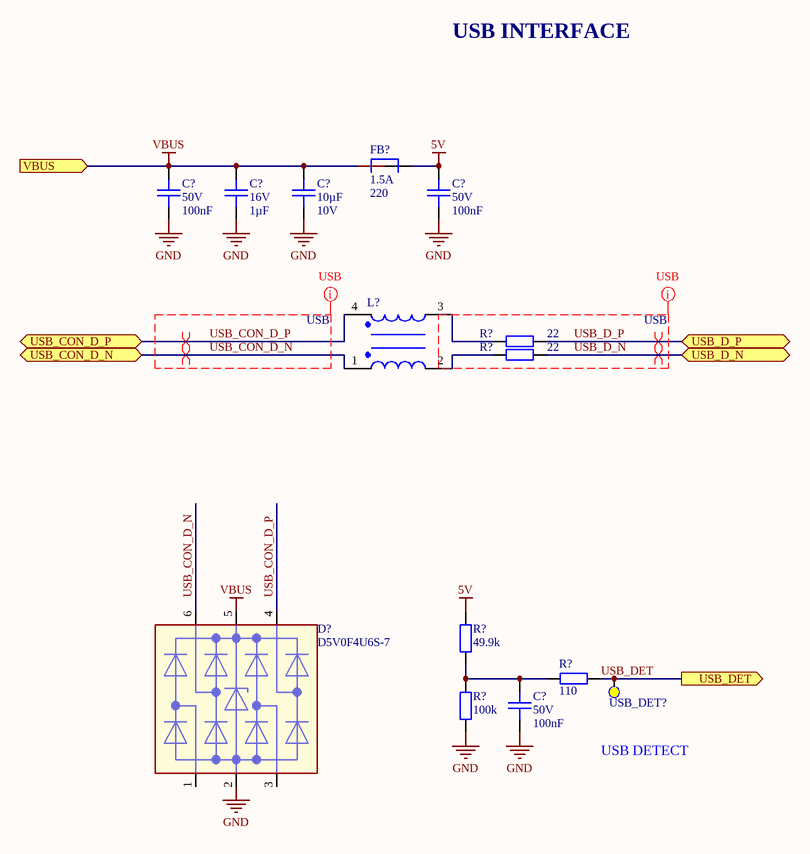
[diagram p11: USB_interface.SchDoc]

### Parts
(Parts that share a designator on the sheet are numbered #1, #2 ... from top to bottom, then left to right.)
C?#151  Voltage Rating: 50V  Capacitance: 100nF  [CAPC100x50x50L25]  (hidden comment: GCM155L8EH104KE07D)
C?#152  Voltage Rating: 16V  Capacitance: 1µF  [CAPC160X80X90L35]  (hidden comment: GCG188L8EE105KA07D)
C?#153  Capacitance: 10µF  Voltage Rating: 10V  [CAPC200X125X145L50]  (hidden comment: CGA4J1X8L1A106K125AC)
C?#154  Voltage Rating: 50V  Capacitance: 100nF  [CAPC100x50x50L25]  (hidden comment: GCM155L8EH104KE07D)
C?#155  Voltage Rating: 50V  Capacitance: 100nF  [CAPC100x50x50L25]  (hidden comment: GCM155L8EH104KE07D)
D?#5  D5V0F4U6S-7  [SOP6P65_200X210X90L85X20]
FB?#13  Imax: 1.5A  Impedance: 220  [BEADC160X80X95L40]  (hidden comment: BLM18KG221BH1D)
L?#1  2 Line Common Mode Choke  [DLW21HN900SQ2L]  (value not drawn)
R?#183  Resistance: 22  [RESC100X50X40L25]  (hidden comment: RC0402FR-0722RL)
R?#184  Resistance: 22  [RESC100X50X40L25]  (hidden comment: RC0402FR-0722RL)
R?#185  Resistance: 49.9k  [RESC100X50X40L25]  (hidden comment: RC0402FR-0749K9L)
R?#186  Resistance: 110  [RESC100X50X40L25]  (hidden comment: RC0402FR-07110RL)
R?#187  Resistance: 100k  [RESC100X50X40L25]  (hidden comment: RC0402FR-07100KL)
USB_DET?  TPAD  [PAD_1.0R]  (value not drawn)  (no BOM)

### Ports
USB_CON_D_N (bidir), USB_CON_D_P (bidir), USB_D_N (bidir), USB_D_P (bidir), USB_DET (out), VBUS (in)

### Nets
5V: C?#154.2 FB?#13.2 R?#185.2
GND: C?#151.1 C?#152.1 C?#153.1 C?#154.1 C?#155.1 D?#5.2 R?#187.1
VBUS: C?#151.2 C?#152.2 C?#153.2 D?#5.5 FB?#13.1 ; port VBUS
USB_CON_D_N: D?#5.6 L?#1.1 ; port USB_CON_D_N
USB_CON_D_P: D?#5.4 L?#1.4 ; port USB_CON_D_P
USB_D_N: R?#184.2 ; port USB_D_N
USB_D_P: R?#183.2 ; port USB_D_P
USB_DET: R?#186.2 USB_DET?.1(TPoint) ; port USB_DET
NetC?#155_2: C?#155.2 R?#185.1 R?#186.1 R?#187.2
NetL?#1_2: L?#1.2 R?#184.1
NetL?#1_3: L?#1.3 R?#183.1

Not connected (* = marked no-connect by the designer): D?#5 1 3

### Layout directives
differential pair: USB_CON_D_N, USB_CON_D_P, USB_D_N, USB_D_P
net class USB: USB_CON_D_N, USB_CON_D_P, USB_D_N, USB_D_P

### Notes on the sheet
- USB INTERFACE
- USB DETECT
- Title
- Size:
- A4
- Number:
- Revision:
- Date:
- Time:
- Sheet
- of

### Library data of the parts
C?#151 C?#154 C?#155 = CMP-001-1980-1: as C?#91-C?#94 on sheet Phase Current_Voltage Sense; Height max: 550µm; ComponentLink3Description: Digikey; Mounting Type: SM; ComponentLink3URL: https://www.digikey.com/en/products/detail/murata-electronics/GCM155L8EH104KE07D/11618823; Package: 0402 (1005 Metric); Lead Spacing: 0mm; MPN: GCM155L8EH104KE07D; Size: 1.00mm x 0.50mm; Ratings: AEC-Q200; ComponentLink1URL: https://search.murata.co.jp/Ceramy/image/img/A01X/G101/ENG/GCM155L8EH104KE07-01.pdf; ComponentLink1Description: Datasheet; Dielectric: X8L; ComponentLink2Description: Mouser; ComponentLink2URL: https://eu.mouser.com/ProductDetail/Murata-Electronics/GCM155L8EH104KE07D?qs=1mbolxNpo8fQSHf0HYnZWw%3D%3D
C?#152 = CMP-001-1982-1: CAP CER 1UF 16V X8L 0603; Manufacturer: Murata Electronics; Tolerance: 10%; Op Temp min: -55°C; Op Temp max: 150°C; ComponentLink3URL: https://www.digikey.com/en/products/detail/murata-electronics/GCG188L8EE105KA07D/10695125; Package: 0603 (1608 Metric); MPN: GCG188L8EE105KA07D; ComponentLink2URL: https://eu.mouser.com/ProductDetail/Murata-Electronics/GCG188L8EE105KA07D?qs=rrS6PyfT74dFMfTR80dVTA%3D%3D; Dielectric: X8L; Size: 1.60mm x 0.80mm; ComponentLink1Description: Datasheet; ComponentLink1URL: https://search.murata.co.jp/Ceramy/image/img/A01X/G101/ENG/GCG188L8EE105KA07-01.pdf; ComponentLink2Description: Mouser; Height max: 900µm; Mounting Type: SM; ComponentLink3Description: Digikey; Lead Spacing: 0mm; Ratings: AEC-Q200
C?#153 = CMP-001-1984-1: CAP CER 10UF 10V X8L 0805; Manufacturer: TDK Corporation; Tolerance: 10%; Op Temp min: -55°C; Op Temp max: 150°C; ComponentLink3Description: Digikey; Mounting Type: SM; Ratings: AEC-Q200; ComponentLink1Description: Datasheet; ComponentLink3URL: https://www.digikey.com/en/products/detail/tdk-corporation/CGA4J1X8L1A106K125AC/9991388; Lead Spacing: 0mm; MPN: CGA4J1X8L1A106K125AC; Size: 2.00mm x 1.25mm; Height max: 1.5mm; ComponentLink2URL: https://eu.mouser.com/ProductDetail/TDK/CGA4J1X8L1A106K125AC?qs=gZXFycFWdANzH%252B2UvJJjtQ%3D%3D; Package: 0805 (2012 Metric); ComponentLink2Description: Mouser; Dielectric: X8L; ComponentLink1URL: https://product.tdk.com/system/files/dam/doc/product/capacitor/ceramic/mlcc/catalog/mlcc_automotive_hightemp_en.pdf
D?#5 = CMP-001-1245-2: TVS DIODE 5.5VWM 12VC SOT363; Manufacturer: Diodes Incorporated; Cap @ Freq: 0.5pF @ 1MHz; Vc: 12V; Op Temp max: 150°C; Unidirectional Channels: 4; P: 200mW; Vbr: 6V; Vrwm: 5.5V; Op Temp min: -55°C; Height max: 1.1mm; ComponentLink3URL: https://www.digikey.com/en/products/detail/diodes-incorporated/D5V0F4U6S-7/7724995?s=N4IgTCBcDaICIFYBqAGAYgFgKoDYDKAtAOwgC6AvkA; Bidirectional Channels: -; Size: 2.15mm x 2.1mm; Mounting Type: SM; ComponentLink1Description: Datasheet; ComponentLink2Description: Mouser; Package: 6-TSSOP, SC-88, SOT-363; MPN: D5V0F4U6S-7; Ratings: -; ComponentLink1URL: https://www.diodes.com/assets/Datasheets/D5V0F4U6S.pdf; ComponentLink2URL: https://eu.mouser.com/ProductDetail/Diodes-Incorporated/D5V0F4U6S-7?qs=L1DZKBg7t5HMc2d93K7aHQ%3D%3D; ComponentLink3Description: Digikey
FB?#13 = CMP-001-1981-1: as FB?#11 on sheet Pressure_sensor_AFE; Mounting Type: SM; Size: 1.60mm x 0.80mm; ComponentLink2URL: https://eu.mouser.com/ProductDetail/Murata-Electronics/BLM18KG221BH1D?qs=sJ5gq5MLFXpgEHYBdWUtkQ%3D%3D; ComponentLink1Description: Datasheet; ComponentLink1URL: https://www.murata.com/en-us/products/productdata/8798137286686/QNFA9129.pdf; Lead Spacing: 0mm; Ratings: AEC-Q200; ComponentLink3Description: Digikey; ComponentLink3URL: https://www.digikey.com/en/products/detail/murata-electronics/BLM18KG221BH1D/6156000; Height max: 950µm; Package: 0603 (1608 Metric); ComponentLink2Description: Mouser; MPN: BLM18KG221BH1D
L?#1 = AWCU00201212900M02: CMC 330MA 2LN 90OHM SMD AEC-Q200; Manufacturer: Pulse Electronics; MPN: AWCU00201212900M02
R?#183 R?#184 = CMP-001-0482-4: as R?#156 on sheet Resolver; Ratings: -; ComponentLink3URL: https://www.digikey.com/en/products/detail/yageo/RC0402FR-0722RL/726562; ComponentLink2URL: https://eu.mouser.com/ProductDetail/YAGEO/RC0402FR-0722RL?qs=V1yeUXFNrkkRg6zf08ADKQ%3D%3D; MPN: RC0402FR-0722RL; ComponentLink1Description: Datasheet; ComponentLink3Description: Digikey; Tolerance: 1%; Size: 1.00mm x 0.50mm; ComponentLink1URL: https://www.yageo.com/upload/media/product/productsearch/datasheet/rchip/PYu-RC_Group_51_RoHS_L_12.pdf; Composition: Thick Film; ComponentLink2Description: Mouser; Mounting Type: SM; Package: 0402 (1005 Metric); Height max: 400µm
R?#185 = CMP-00547-4: RES 49.9K OHM 1% 1/16W 0402; Manufacturer: YAGEO; Temperature Coefficient: ±100ppm; Power: 63mW; Op Temp min: -55°C; Op Temp max: 155°C; ComponentLink1Description: Datasheet; Composition: Thick Film; Ratings: -; ComponentLink2URL: https://eu.mouser.com/ProductDetail/YAGEO/RC0402FR-0749K9L?qs=QT1cPpUoD8GsWnpgOWR2jA%3D%3D; ComponentLink3URL: https://www.digikey.com/en/products/detail/yageo/RC0402FR-0749K9L/726620; ComponentLink2Description: Mouser; MPN: RC0402FR-0749K9L; Package: 0402 (1005 Metric); Mounting Type: SM; ComponentLink1URL: https://www.yageo.com/upload/media/product/productsearch/datasheet/rchip/PYu-RC_Group_51_RoHS_L_12.pdf; Size: 1.00mm x 0.50mm; Tolerance: 1%; ComponentLink3Description: Digikey; Height max: 400µm
R?#186 = CMP-001-0497-6: as R?#151 on sheet Resolver; Size: 1.00mm x 0.50mm; ComponentLink1Description: Datasheet; Package: 0402 (1005 Metric); ComponentLink2URL: https://eu.mouser.com/ProductDetail/YAGEO/RC0402FR-07110RL?qs=QWYorlrD8IXj7iGvwWbRbA%3D%3D; MPN: RC0402FR-07110RL; ComponentLink3Description: Digikey; Height max: 400µm; Ratings: -; ComponentLink3URL: https://www.digikey.com/en/products/detail/yageo/RC0402FR-07110RL/2827583; Composition: Thick Film; ComponentLink2Description: Mouser; Tolerance: 1%; Mounting Type: SM; ComponentLink1URL: https://www.yageo.com/upload/media/product/productsearch/datasheet/rchip/PYu-RC_Group_51_RoHS_L_12.pdf
R?#187 = CMP-00121-6: RES 100K OHM 1% 1/16W 0402; Manufacturer: YAGEO; Op Temp min: -55°C; Op Temp max: 155°C; Power: 63mW; Temperature Coefficient: ±100ppm; ComponentLink2Description: Mouser; Mounting Type: SM; Composition: Thick Film; ComponentLink3URL: https://www.digikey.com/en/products/detail/yageo/RC0402FR-07100KL/726526; Size: 1.00mm x 0.50mm; MPN: RC0402FR-07100KL; Tolerance: 1%; Ratings: -; ComponentLink1Description: Datasheet; ComponentLink2URL: https://eu.mouser.com/ProductDetail/YAGEO/RC0402FR-07100KL?qs=%2Fha2pyFaduhjtLcYvKXQ8IUndG0u%252BuCx1gxMxvN%252Btd7iB7mgHWsSbw%3D%3D; Package: 0402 (1005 Metric); ComponentLink1URL: https://www.yageo.com/upload/media/product/productsearch/datasheet/rchip/PYu-RC_Group_51_RoHS_L_12.pdf; ComponentLink3Description: Digikey; Height max: 400µm
USB_DET? = TPAD: Test Pad, SMD; Group: Test point